# Altium schematic sheet CAN_channel.SchDoc: BYTE SPIne - CAN Channel (STM32F072 + TCAN1042)
size A4; DocumentNumber: BYTE-SPINE-02; SheetNumber: 2; SheetTotal: 3
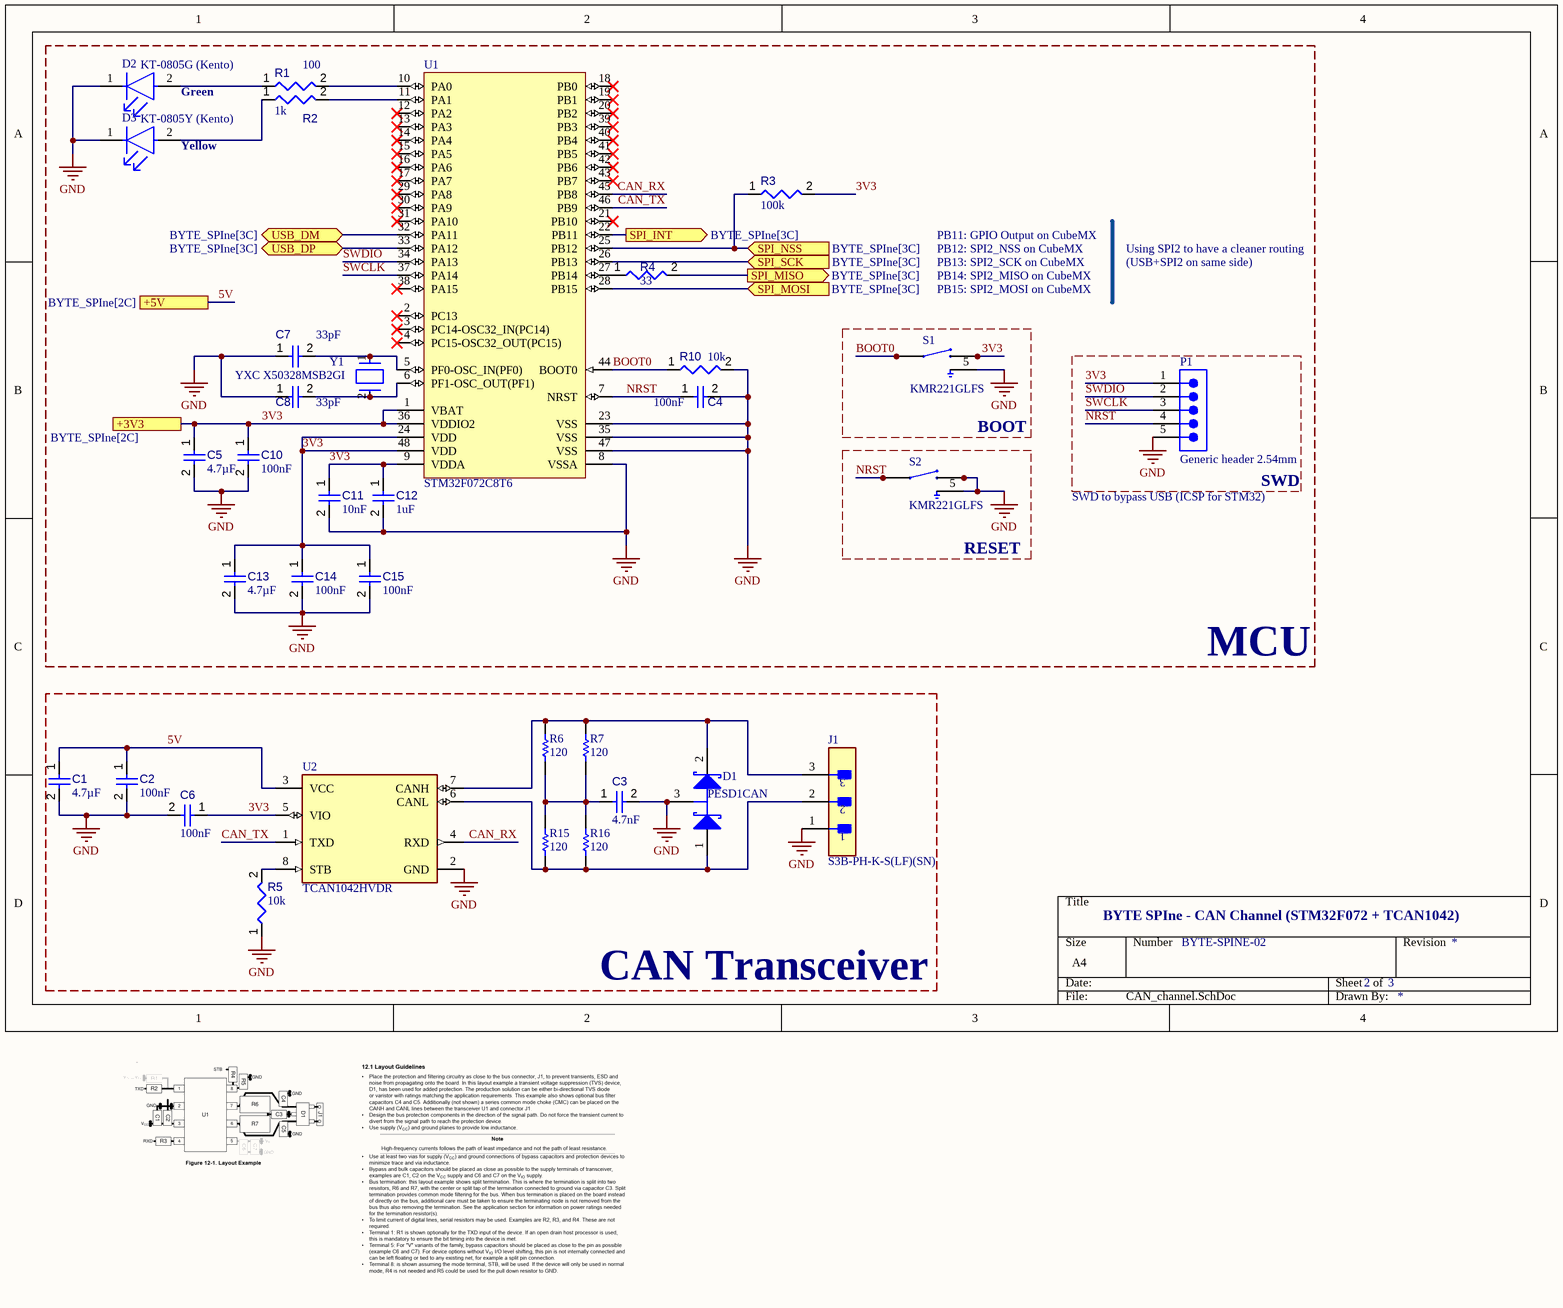
[diagram p0: CAN_channel.SchDoc]

## Parts
C1  value 4.7µF  [CAPC0603(1608)100_L]  (hidden comment: 4.7uF)
C2  100nF  [CAPC1608X90X40NL10T20]
C3  4.7nF  [CAPC1608X90X40NL10T20]
C4  100nF  [CAPC1608X90X40NL10T20]
C5  value 4.7µF  [CAPC0603(1608)100_L]  (hidden comment: 4.7uF)
C6  100nF  [CAPC1608X90X40NL10T20]
C7  33pF  [CAPC0402(1005)60_L]
C8  33pF  [CAPC0402(1005)60_L]
C10  100nF  [CAPC1608X90X40NL10T20]
C11  10nF  [CAPC1608X90X40NL10T20]
C12  1uF  [CAPC1608X90X40NL10T20]
C13  value 4.7µF  [CAPC0603(1608)100_L]  (hidden comment: 4.7uF)
C14  100nF  [CAPC1608X90X40NL10T20]
C15  100nF  [CAPC1608X90X40NL10T20]
D1  PESD1CAN  [FAIR-SOT23-3_V]
D2  KT-0805G (Kento)  [FP-LTST-C170GKT-MFG]
D3  KT-0805Y (Kento)  [FP-LTST-C170GKT-MFG]
J1  S3B-PH-K-S(LF)(SN)  [FP-S3B-PH-K-S_LF_SN-MFG]  (no BOM)
P1  Generic header 2.54mm  [61300511121]  (no BOM)
R1  100  [RESC0402(1005)_L]
R2  1k  [RESC0402(1005)_L]
R3  100k  [RESC1608X55X25ML10T15]
R4  33  [RESC1608X55X25ML10T15]
R5  10k  [RESC1608X55X25ML10T15]
R6  120  [RESC3116X70X50ML13T20]
R7  120  [RESC3116X70X50ML13T20]
R10  10k  [RESC1608X55X25ML10T15]
R15  120  [RESC3116X70X50ML13T20]
R16  120  [RESC3116X70X50ML13T20]
S1  KMR221GLFS  [SW_KMR221GLFS]
S2  KMR221GLFS  [SW_KMR221GLFS]
U1  STM32F072C8T6  [STM-LQFP48_M]
U2  TCAN1042HVDR  [FP-D0008B-IPC_B]
Y1  YXC X50328MSB2GI  [FP-ABM3-MFG]

## Blocks framed on the sheet
MCU: C4 C5 C7 C8 C10-C15 D2 D3 R1-R4 R10 U1 Y1
BOOT: S1
SWD: P1
RESET: S2
CAN Transceiver: C1-C3 C6 D1 J1 R5-R7 R15 R16 U2

## Ports
+3V3 (see BYTE_SPIne[2C]), +5V (see BYTE_SPIne[2C]), SPI_INT (out, see BYTE_SPIne[3C]), SPI_MISO (out, see BYTE_SPIne[3C]), SPI_MOSI (in, see BYTE_SPIne[3C]), SPI_NSS (in, see BYTE_SPIne[3C]), SPI_SCK (in, see BYTE_SPIne[3C]), USB_DM (bidir, see BYTE_SPIne[3C]), USB_DP (bidir, see BYTE_SPIne[3C])

## Nets
GND: C1.2 C2.2 C3.2 C4.2 C5.2 C6.2 C7.1 C8.1 C10.2 C11.2 C12.2 C13.2 C14.2 C15.2 D1.3(C) D2.1(C) D3.1(C) J1.1 P1.5 R5.1 R10.2 S1.5 S2.2 S2.3 S2.5 U1.8(VSSA) U1.23(VSS) U1.35(VSS) U1.47(VSS) U2.2(GND)
3V3: C5.1 C6.1 C10.1 C11.1 C12.1 C13.1 C14.1 C15.1 P1.1 R3.2 S1.2 S1.3 U1.1(VBAT) U1.9(VDDA) U1.24(VDD) U1.36(VDDIO2) U1.48(VDD) U2.5(VIO) ; port +3V3
5V: C1.1 C2.1 U2.3(VCC) ; port +5V
BOOT0: R10.1 S1.1 S1.4 U1.44(BOOT0)
CAN_RX: U1.45(PB8) U2.4(RXD)
CAN_TX: U1.46(PB9) U2.1(TXD)
NRST: C4.1 P1.4 S2.1 S2.4 U1.7(NRST)
SPI_INT: U1.22(PB11) ; port SPI_INT
SPI_MISO: R4.2 ; port SPI_MISO
SPI_MOSI: U1.28(PB15) ; port SPI_MOSI
SPI_NSS: R3.1 U1.25(PB12) ; port SPI_NSS
SPI_SCK: U1.26(PB13) ; port SPI_SCK
SWCLK: P1.3 U1.37(PA14)
SWDIO: P1.2 U1.34(PA13)
USB_DM: U1.32(PA11) ; port USB_DM
USB_DP: U1.33(PA12) ; port USB_DP
NetC3_1: C3.1 R6.1 R7.1 R15.2 R16.2
NetC7_2: C7.2 U1.5(PF0-OSC_IN(PF0)) Y1.1
NetC8_2: C8.2 U1.6(PF1-OSC_OUT(PF1)) Y1.2
NetD1_1: D1.1(A) J1.2 R15.1 R16.1 U2.6(CANL)
NetD1_2: D1.2(K) J1.3 R6.2 R7.2 U2.7(CANH)
NetD2_2: D2.2(A) R1.1
NetD3_2: D3.2(A) R2.1
NetR1_2: R1.2 U1.10(PA0)
NetR2_2: R2.2 U1.11(PA1)
NetR4_1: R4.1 U1.27(PB14)
NetR5_2: R5.2 U2.8(STB)

Not connected (* = marked no-connect by the designer): U1 2(PC13)* 3(PC14-OSC32_IN(PC14))* 4(PC15-OSC32_OUT(PC15))* 12(PA2)* 13(PA3)* 14(PA4)* 15(PA5)* 16(PA6)* 17(PA7)* 18(PB0)* 19(PB1)* 20(PB2)* 21(PB10)* 29(PA8)* 30(PA9)* 31(PA10)* 38(PA15)* 39(PB3)* 40(PB4)* 41(PB5)* 42(PB6)* 43(PB7)*

## Notes on the sheet
- (near D2) Green
- (near D3) Yellow
- PB11: GPIO Output on CubeMX
- PB12: SPI2_NSS on CubeMX
- Using SPI2 to have a cleaner routing
- PB13: SPI2_SCK on CubeMX
- PB14: SPI2_MISO on CubeMX
- PB15: SPI2_MOSI on CubeMX
- (USB+SPI2 on same side)
- SWD to bypass USB (ICSP for STM32)

## Library data of the parts
C1 C5 C13 = CMP-001-00076-4: 0603; Tolerance: 10%; Voltage Rating: 10V; Mounting Technology: SMT; Case/Package: 0603; Pins: 2; Min Operating Temperature: -55°C; Max Operating Temperature: 85°C; LCSC: C19666
C2-C4 C6 C10-C12 C14 C15 = CMP-001-00017-6: 0603; Tolerance: 10%; Voltage Rating: 50V; Capacitor Type: Ceramic; Mounting Technology: SM; Max Operating Temperature: 125°C; RoHS Compliant: True; Pins: 2; Case/Package: 0603; Min Operating Temperature: -55°C
  C2 C4 C6 C10 C14 C15: Value: 100nF; LCSC: C14663
  C3: Value: 4.7nF; LCSC: C53987
  C11: Value: 10nF; LCSC: C57112
  C12: Value: 1uF; LCSC: C15849
C7 = CMP-001-00073-3: Chip Capacitor, 33 pF +/-10%, 50V, 0402, Thickness 0.6 mm; Tolerance: 10%; Pins: 2; Voltage Rating: 50V; Max Operating Temperature: 85°C; Min Operating Temperature: -55°C; Mounting Technology: SMT; Case/Package: 0402; Value: 33pF; LCSC: C1562
C8 = CMP-001-00073-3: 0402; Voltage Rating: 50V; Tolerance: 10%; Pins: 2; Max Operating Temperature: 85°C; Min Operating Temperature: -55°C; Mounting Technology: SMT; Case/Package: 0402; Value: 33pF; LCSC: C1562
D1 = CMP-004-00013-2: Package Reference: SOT23-3; Pins: 3; Case/Package: SOT-23; LCSC: C15771
D2 = CMP-1674-00002-6: LED GREEN CLEAR SMD; Dominant Wavelength: 569nm; Lens Style: Diffused; Forward Voltage: 2.1V; Number of Elements: 1; Wavelength: 565nm; Luminous Intensity: 6mcd; Test Current: 10mA; Power Dissipation: 100mW; Reverse Voltage: 5V; Forward Current: 30mA; Viewing Angle: 130°; Lens Color: Colorless; Min Operating Temperature: -55°C; Number of Pins: 2; Max Operating Temperature: 85°C; Color: Green; Radiation Hardening: No; Illumination Color: Green; Case Code (Metric): 2012; Lens Transparency: Clear; Case/Package: 0805; Width: 1.25mm; Case Code (Imperial): 0805; Package Quantity: 1; Height: 1.1mm; Depth: 1.25mm; Length: 2mm; Power Rating: 100mW; Lead Free: Lead Free; Number of LEDs: 1; Packaging: Tape and Reel; Mount: Surface Mount; Voltage: 5V; LCSC: C2297
D3 = CMP-1674-00002-6: LED YELLOW CLEAR SMD; Dominant Wavelength: 569nm; Lens Style: Diffused; Forward Voltage: 2.1V; Number of Elements: 1; Color: Green; Wavelength: 565nm; Luminous Intensity: 6mcd; Test Current: 10mA; Power Dissipation: 100mW; Reverse Voltage: 5V; Forward Current: 30mA; Viewing Angle: 130°; Lens Color: Colorless; Min Operating Temperature: -55°C; Number of Pins: 2; Max Operating Temperature: 85°C; Radiation Hardening: No; Illumination Color: Green; Case Code (Metric): 2012; Lens Transparency: Clear; Case/Package: 0805; Width: 1.25mm; Case Code (Imperial): 0805; Package Quantity: 1; Height: 1.1mm; Depth: 1.25mm; Length: 2mm; Power Rating: 100mW; Lead Free: Lead Free; Number of LEDs: 1; Packaging: Tape and Reel; Mount: Surface Mount; Voltage: 5V; LCSC: C2296
J1 = CMP-17439-000039-1: CONN HEADER R/A 3POS 2MM; Height: 0.31inch; Weight: 0.0625lb; Length: 0.31inch; Width: 0.31inch
P1 = CMP-1502-01068-4: THT Vertical Pin Header WR-PHD, Pitch 2.54 mm, Single Row, 5 pins; Number of Contacts: 5; Connector Type: Male Pin; Operating Supply Voltage: 250V; Contact Resistance: 20mΩ; Gender: Male; Current Rating: 3A; Min Operating Temperature: -40°C; Contact Material: Gold; Color: Black; Pitch: 2.54mm; RoHS: Compliant; Number of Rows: 1; Lead Free: Lead Free; Height: 8.89mm; Contact Plating: Gold; Number of Pins: 5; Orientation: Vertical; Voltage Rating: 250V; Packaging: Bulk; Number of Positions: 5; Max Operating Temperature: 105°C; Termination: Solder; Lead Pitch: 2.54mm; Contact Mating Length: 5.9944mm; Mount: Through Hole
R1 R2 = CMP-009-00114-3: Power: 63mW; Tolerance: 5%; Pins: 2; Mounting Technology: SMT; Case/Package: 0402
  R1: Value: 100; LCSC: C25076
  R2: Value: 1k; LCSC: C11702
R3-R5 R10 = CMP-009-00031-5: Tolerance: 1%; Power: 100mW; Mounting Technology: SM; Case/Package: 0603; RoHS Compliant: True; Pins: 2; Min Operating Temperature: -55°C; Max Operating Temperature: 155°C
  R3: Value: 100k; LCSC: C25803
  R4: Value: 33; LCSC: C23140
  R5 R10: Value: 10k; LCSC: C25804
R6 R7 R15 R16 = CMP-009-00011-5: 1206; Tolerance: 1%; Voltage Rating: 200V; Power: 250mW; Max Operating Temperature: 155°C; Mounting Technology: SM; Case/Package: 1206; RoHS Compliant: True; Min Operating Temperature: -55°C; Value: 120; Pins: 2; LCSC: C17909
S1 S2 = KMR221GLFS: Switch Tactile N.O. SPST Button Gull Wing 0.05A 32VDC 1VA 200000Cycles 2N SMD Automotive T/R; MF: CK; SnapEDA_Link: https://www.snapeda.com/parts/KMR221G%20LFS/C%2526K/view-part/?ref=snap; Package: None; Value: *; MP: KMR221G LFS; Check_prices: https://www.snapeda.com/parts/KMR221G%20LFS/C%2526K/view-part/?ref=eda; LCSC: C72443
U1 = CMP-0304-00166-4: ARM Cortex-M0 32-bit MCU, 64 KB Flash, 16 KB Internal RAM, 37 I/Os, 48-Pin LQFP, -40 to 85 degC, Tray; Manufacturer: STMicroelectronics; Operating Frequency(F) (Processor speed) (MHz): 48; FLASH Size (Prog) (kB): 64; I/Os (High Current): 37; D/A Converter: 1; Internal RAM Size (kB): 16; Supply Voltage(Vcc) min (V): 2; Package Reference: LQFP48; DatasheetVersion: Rev. 5; Core: ARM Cortex-M0; ComponentLink1Description: Manufacturer URL; ComponentLink1URL: http://www.st.com/; Packing: Tray; Mounting Technology: Surface Mount; Package Description: 48-Pin Low Profile Quad Flat Package, Body 7 x 7 mm, Pitch 0.5 mm; ComponentLink2URL: http://www.st.com/st-web-ui/static/active/en/resource/technical/document/datasheet/DM00090510.pdf; ComponentLink2Description: Datasheet; PartNumber: STM32F072C8T6; LCSC: C80488
U2 = CMP-04872-000069-1: IC TRANSCEIVER 1/1 8SOIC; Number of Transmit Buffers: 1; Data Rate: 2Mbps; Max Supply Voltage: 5.5V; Receiver Hysteresis: 120mV; Min Supply Voltage: 4.5V; Mount: Surface Mount; Max Operating Temperature: 125°C; REACH SVHC: No SVHC; Lead Free: Lead Free; RoHS Compliant: Yes; Number of Pins: 8; Packaging: Cut Tape; Case/Package: SOIC; Min Operating Temperature: -55°C; Number of Receive Buffers: 1; LCSC: C127869
Y1 = CMP-2000-05033-2: Load Capacitance: 18pF; Tolerance: 20ppm; Frequency: 8MHz; Series Resistance: 500R; Frequency Stability: 30ppm; ESR (Equivalent Series Resistance): 140R; Height: 0.051inch; Depth: 3.2mm; Max Operating Temperature: 85°C; Termination: SMD/SMT; Lead Free: Lead Free; Number of Pins: 2; Width: 3.2mm; RoHS Compliant: Yes; Resistor Type: Ceramic; Length: 5mm; Mount: Surface Mount; Case/Package: CSMD; Package Quantity: 1000; Radiation Hardening: No; Min Operating Temperature: -40°C; Packaging: Tape and Reel; Frequency Tolerance: 20ppm; LCSC: C115962